# Altium schematic sheet Controlador_BombaDeAgua(analogico).SchDoc
size A2; SheetNumber: 1; SheetTotal: 1
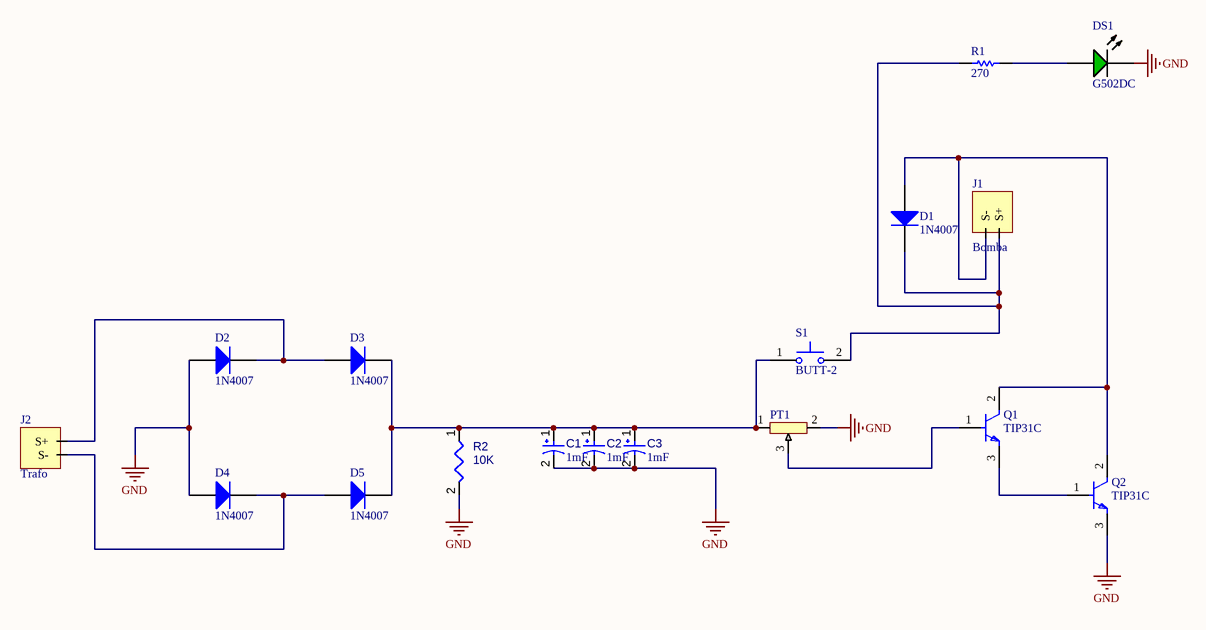
[diagram p0: Controlador_BombaDeAgua(analogico).SchDoc]

## Parts
C1  value 1mF  [CAPPR65-500-2000X1000X2200]  (hidden comment: ECA1EM102)
C2  value 1mF  [CAPPR65-500-2000X1000X2200]  (hidden comment: ECA1EM102)
C3  value 1mF  [CAPPR65-500-2000X1000X2200]  (hidden comment: ECA1EM102)
D1  1N4007  [FAIR-DO-41-2]
D2  1N4007  [FAIR-DO-41-2]
D3  1N4007  [FAIR-DO-41-2]
D4  1N4007  [FAIR-DO-41-2]
D5  1N4007  [FAIR-DO-41-2]
DS1  G502DC  [CGX-G502DC]
J1  Bomba  [Header 2]
J2  Trafo  [Header 2]
PT1  Potenciômetro  [Potenciômetro 10K]  (value not drawn)
Q1  TIP31C  [FP-TO-220-P0A0015988-MFG]
Q2  TIP31C  [FP-TO-220-P0A0015988-MFG]
R1  270  [RESC2010(5025)_M]
R2  10K  [RESC0805(2012)_L]
S1  BUTT-2  [SW_BUTT-2]

## Nets
GND: C1.2 C2.2 C3.2 D2.2(A) D4.2(A) DS1.2(K) PT1.2 Q2.3(E) R2.2
NetC1_1: C1.1 C2.1 C3.1 D3.1(K) D5.1(K) PT1.1 R2.1 S1.1
NetD1_1: D1.1(K) J1.0(S+) R1.1 S1.2
NetD1_2: D1.2(A) J1.1(S-) Q1.2(C) Q2.2(C)
NetD2_1: D2.1(K) D3.2(A) J2.0(S+)
NetD4_1: D4.1(K) D5.2(A) J2.1(S-)
NetDS1_1: DS1.1(A) R1.2
NetPT1_3: PT1.3 Q1.1(B)
NetQ1_3: Q1.3(E) Q2.1(B)

## Library data of the parts
C1-C3 = CMP-001-00023-8: Aluminum Electrolytic Capacitor, 1000 uF, +/- 20%, 25 V, -40 to 85 degC, 2-Pin THD, RoHS, Bulk; Manufacturer: Panasonic; Ripple Current: 850mA; Voltage Rating: 25V; Lead Pitch: 5mm; Datasheet URL: https://industrial.panasonic.com/cdbs/www-data/pdf/RDF0000/ABA0000C1218.pdf; Packaging: Bulk; Package Reference: CAPPR65-500-2000X1000X2200; Package Description: 2-Pin Radial Lead, Dia 10 mm, Height 22 mm; Diameter: 10mm; Min Operating Temperature: -40°C; Datasheet Version: Rev. 05, 10/2016; RoHS Compliant: True; Capacitor Type: Electrolytic; Tolerance: 20%; Mounting Technology: TH; Manufacturer URL: http://www.panasonic.com/; Max Operating Temperature: 85°C; Package Quantity: 200; Case/Package: Radial
D1-D5 = CMP-004-00007-2: General Purpose Rectifier, 1.1 V, 1.0 A, -55 to 175 degC, 2-Pin DO-41, RoHS, Tape and Reel; Manufacturer: Fairchild; Peak Reverse Current: 5uA; Max Surge Current: 30A; Elements: 1; Forward Voltage: 1.1V; Package Version: Rev. 2, 09/2008; Forward Current: 1A; Package Quantity: 5000; Packaging: TapeandReel; Package URL: http://www.fairchildsemi.com/dwg/DO/DO41A.pdf; Manufacturer URL: https://www.fairchildsemi.com/; Package Reference: DO-41-2; Pins: 2; Min Operating Temperature: -55°C; Datasheet Version: Rev. 1.1.0, 11/2014; Max Operating Temperature: 175°C; RoHS Compliant: True; Case/Package: DO-41-2; Mounting Technology: TH; Package Description: 2-Pin Axial Lead, Dia 2.375 mm, Body Length 4.63 mm; Datasheet URL: https://www.fairchildsemi.com/datasheets/1N/1N4007.pdf
DS1 = CMP-007-00008-2: Green LED, 80 mW, 20 mA, -25 to 85 degC, 2-Pin THD; Manufacturer: Shenzhen CGX; Mounting Technology: TH; Package Reference: G502DC; Datasheet Version: Sep-14; Manufacturer URL: http://szcgx.com/; Package Description: 2-Pin Through Hole Device, Dia 5.9 mm; Datasheet URL: http://datasheet.octopart.com/G502DC-Chengguangxing-datasheet-62330340.pdf; Case/Package: G502DC; RoHS Compliant: Unknown
J1 J2 = CMP-040-000034-1: Design Item ID: Header 2; Source: FIFILIB.SchLib
PT1 = CMP-040-000215-1: Design Item ID: Potenciômetro; Source: TROIA2.2.SchLib
Q1 Q2 = CMP-12195-000001-1: TRANS NPN 100V 3A TO-220; Manufacturer: STMicroelectronics; Hfe Max: 50; Number Of Npn: 1; Max Junction Temp: +150°C; Standoff Height: 3.5mm; Emitter Base Voltage: 5V; Collector Emitter Saturation Voltage: 1.2V; Power Dissipation: 2W; Hfe Testvce: 4V; Hfe Min: 10; Device Class L2: Transistors; ComponentLink2URL: https://www.st.com/resource/en/datasheet/tip31c.pdf; Device Class L1: Discrete Semiconductors; Digikey Description: TRANS NPN 100V 3A TO-220; Max Collector Current: 3A; RoHS: TRUE; Height: 19.68mm; Mouser Description: Bipolar Transistors - BJT NPN Gen Pur Power; Number Of Elements: 1; Package: TO-220-P0A0015988; Temperature: to +150°C; Octopart: https://octopart.com/tip31c-stmicroelectronics-15555; Manufacturer Part Number: TIP31C; Category: Trans; Hfe Testic: 3A; Lead Free: Yes; Collector Base Voltage: 100V; Device Class L3: BJTs; Collector Emitter Voltage: 100V; Automotive: No; ComponentLink2Description: Datasheet; Temperature Range High: +150°C
R1 = CMP-1017-00444-1: 270R 0.75W 1% 2010 (5025 Metric)  SMD; Value: 270.00 Ohm; Case-EIA: 2010; Case-Metric: 5025; Power: 0.75 W; Technology: SMT; Tolerance: 1 %
R2 = CMP-009-00318-1: Chip Resistor, 10 KOhm, +/- 1%, 0.25 W, -55 to 155 degC, 1206 (3216 Metric); Power: 250mW; Voltage Rating: 200V; Available Preview Images: 2D; RoHS Compliant: True; Pins: 2; Min Operating Temperature: -55°C; Max Operating Temperature: 155°C; Case/Package: 1206; Value: 10k; Tolerance: 1%; Mounting Technology: SM; Source: Components - 14.12.25 - 13.59.SchLib; Design Item ID: CMP-009-00016-5
S1 = CMP-011-00029-1: Tactile Switches MINI PUSH BUTTON SWITCH 2-PIN QTY. 4; MF: Gravitech; Case/Package: None; Check_prices: https://www.snapeda.com/parts/BUTT-2/Gravitech/view-part/?ref=eda; Availability: In Stock; SnapEDA_Link: https://www.snapeda.com/parts/BUTT-2/Gravitech/view-part/?ref=snap; MP: BUTT-2; Source: BUTT-2.SchLib; Purchase-URL: https://pricing.snapeda.com/search/part/BUTT-2/?ref=eda; Component Type: Standard; Pins: 2; Value: *; Design Item ID: BUTT-2; Price: None